# Altium schematic sheet Portable_filter.SchDoc
size A4; SheetNumber: 1; SheetTotal: 1
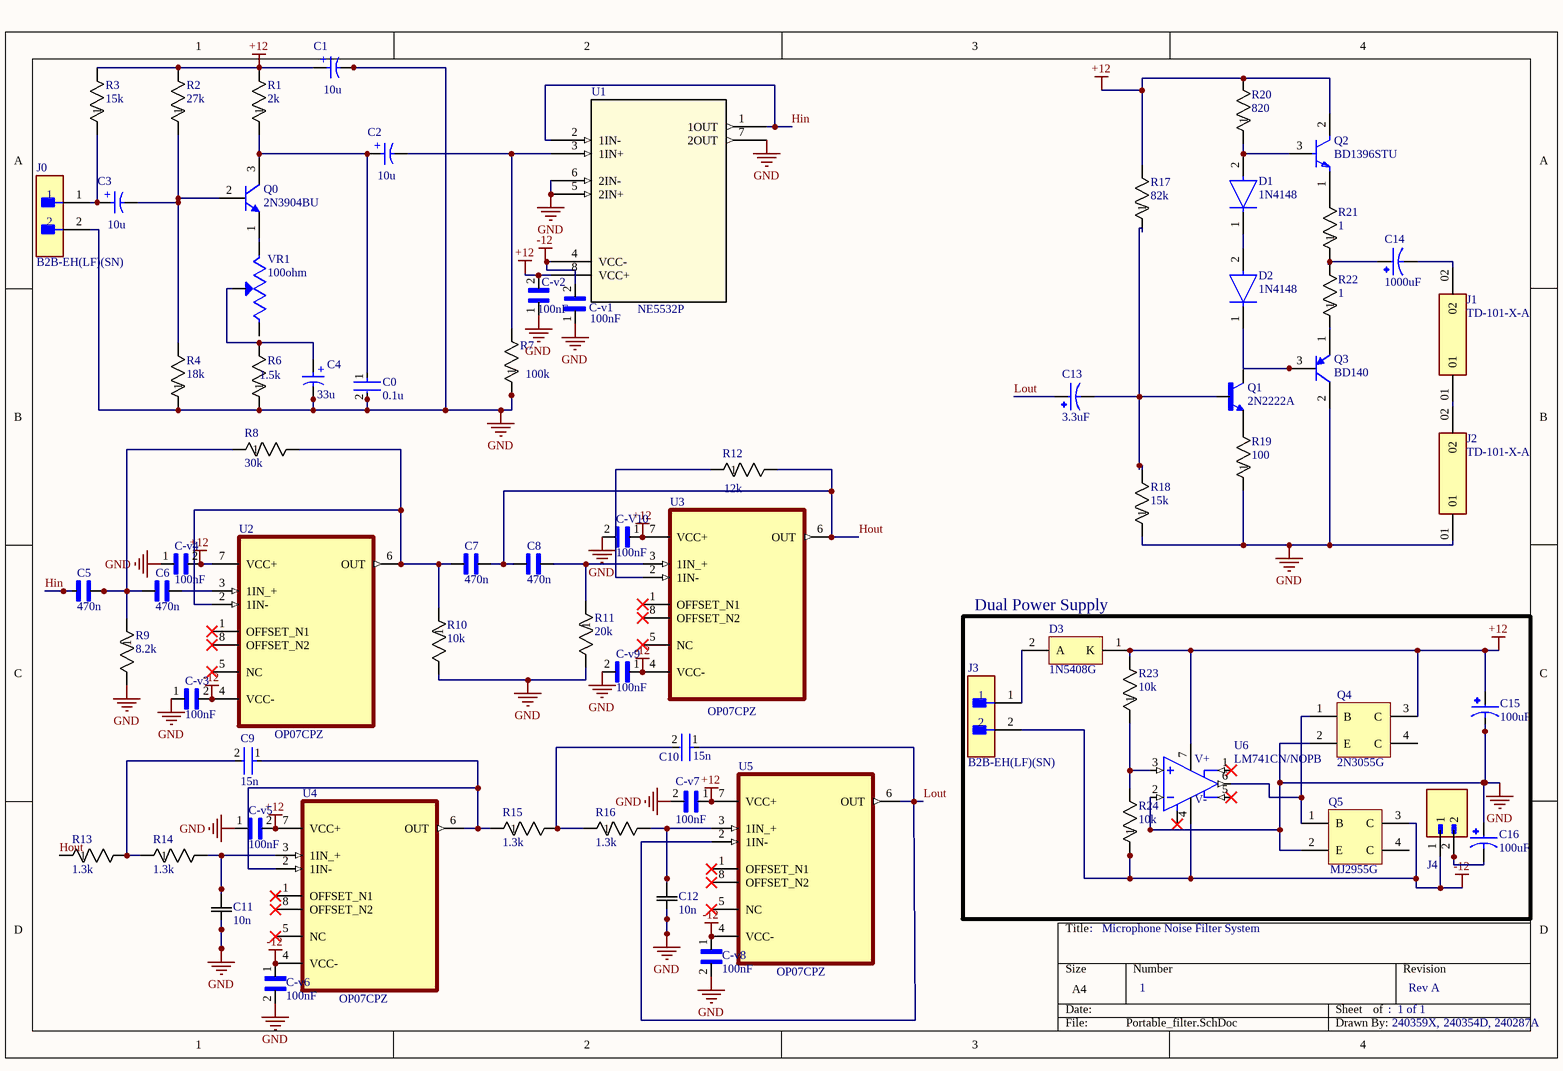
[diagram p0: Portable_filter.SchDoc]

## Parts
C0  0.1u  [FP-RCE2A2-MFG]
C1  10u  [WCAP-ATLL_D5H11]
C2  10u  [WCAP-ATLL_D5H11]
C3  10u  [WCAP-ATLL_D5H11]
C4  33u  [WCAP-ATG5_D6.3H11]
C5  470n  [CAPRR1000W60L1300T400H900]
C6  470n  [CAPRR1000W60L1300T400H900]
C7  470n  [CAPRR1000W60L1300T400H900]
C8  470n  [CAPRR1000W60L1300T400H900]
C9  15n  [FP-RDE0P1-MFG]
C10  15n  [FP-RDE0P1-MFG]
C11  10n  [K103K10X7RF53L2_VIS]
C12  10n  [K103K10X7RF53L2_VIS]
C13  3.3uF  [CAPPRD150W45D400H700]
C14  1000uF  [CAPPRD500W60D1000H2500]
C15  100uF  [CAPPRD250W50D630H1120]
C16  100uF  [CAPPRD250W50D630H1120]
C-v1  100nF  [CAPRR508W50L508T318H762]
C-v2  100nF  [CAPRR508W50L508T318H762]
C-v3  100nF  [CAPRR508W50L508T318H762]
C-v4  100nF  [CAPRR508W50L508T318H762]
C-v5  100nF  [CAPRR508W50L508T318H762]
C-v6  100nF  [CAPRR508W50L508T318H762]
C-v7  100nF  [CAPRR508W50L508T318H762]
C-v8  100nF  [CAPRR508W50L508T318H762]
C-v9  100nF  [CAPRR508W50L508T318H762]
C-V10  100nF  [CAPRR508W50L508T318H762]
D1  1N4148  [FP-017AG-MFG]
D2  1N4148  [FP-017AG-MFG]
D3  1N5408G  [ONSC-AXIAL_LEAD-2-267-05_V]
J0  B2B-EH(LF)(SN)  [FP-B2B-EH_LF_SN-MFG]
J1  TD-101-X-A  [SAMTEC_TD-101-X-A]
J2  TD-101-X-A  [SAMTEC_TD-101-X-A]
J3  B2B-EH(LF)(SN)  [FP-B2B-EH_LF_SN-MFG]
J4  M20-9990246  [HARWIN_M20-9990246]  (value not drawn)
Q0  2N3904BU  [FAIR-TO-92]
Q1  2N2222A  [TO92254P470H750-3]
Q2  BD1396STU  [FP-340AS-MFG]
Q3  BD140  [ONSC-TO-225-3-77-09]
Q4  2N3055G  [ONSC-TO-204-3-1-07]
Q5  MJ2955G  [ONSC-TO-204-3-1-07]
R1  2k  [RES_VISHAY_HVR37_VIS]
R2  27k  [RES_VISHAY_HVR37_VIS]
R3  15k  [RES_VISHAY_HVR37_VIS]
R4  18k  [RES_VISHAY_HVR37_VIS]
R6  1.5k  [RES_VISHAY_HVR37_VIS]
R7  100k  [RES_VISHAY_HVR37_VIS]
R8  30k  [RES_VISHAY_HVR37_VIS]
R9  8.2k  [RES_VISHAY_HVR37_VIS]
R10  10k  [RES_VISHAY_HVR37_VIS]
R11  20k  [RES_VISHAY_HVR37_VIS]
R12  12k  [RES_VISHAY_HVR37_VIS]
R13  1.3k  [RES_VISHAY_HVR37_VIS]
R14  1.3k  [RES_VISHAY_HVR37_VIS]
R15  1.3k  [RES_VISHAY_HVR37_VIS]
R16  1.3k  [RES_VISHAY_HVR37_VIS]
R17  82k  [RES_VISHAY_HVR37_VIS]
R18  15k  [RES_VISHAY_HVR37_VIS]
R19  100  [RES_VISHAY_HVR37_VIS]
R20  820  [RES_VISHAY_HVR37_VIS]
R21  1  [RES_VISHAY_HVR37_VIS]
R22  1  [RES_VISHAY_HVR37_VIS]
R23  10k  [RES_VISHAY_HVR37_VIS]
R24  10k  [RES_VISHAY_HVR37_VIS]
U1  NE5532P  [P8]
U2  OP07CPZ  [DIP254P762X508-8]
U3  OP07CPZ  [DIP254P762X508-8]
U4  OP07CPZ  [DIP254P762X508-8]
U5  OP07CPZ  [DIP254P762X508-8]
U6  LM741CN/NOPB  [DIP794W45P254L959H508Q8]
VR1  100ohm  [TRIM_3296W-1-101LF]

## Blocks framed on the sheet
Dual Power Supply: C15 C16 D3 J3 J4 Q4 Q5 R23 R24 U6

## Nets
+12: C1.1(P) C15.P C-v2.2 C-v4.2 C-v5.2 C-v7.1 C-V10.1 D3.1(K) Q2.2(C) Q4.3(C) R1.2 R2.2 R3.2 R17.2 R20.2 R23.2 U1.8(VCC+) U2.7(VCC+) U3.7(VCC+) U4.7(VCC+) U5.7(VCC+) U6.7(V+)
-12: C-v1.2 C-v3.2 C-v6.1 C-v8.1 C-v9.1 J3.2 J4.1 Q5.3(C) R24.1 U1.4(VCC-) U2.4(VCC-) U3.4(VCC-) U4.4(VCC-) U5.4(VCC-) U6.4(V-)
GND: C0.2 C1.2(N) C4.2(N) C11.2 C12.2 C15.N C16.P C-v1.1 C-v2.1 C-v3.1 C-v4.1 C-v5.1 C-v6.2 C-v7.2 C-v8.2 C-v9.2 C-V10.2 J0.2 J2.01 Q3.2(C) Q4.2(E) Q5.2(E) R4.1 R6.1 R7.1 R9.2 R10.2 R11.2 R18.1 R19.1 U1.5(2IN+) U1.6(2IN-) U1.7(2OUT) U6.2(-IN)
Hin: C5.1 U1.1(1OUT) U1.2(1IN-)
Hout: C7.2 C8.1 R12.2 R13.1 U3.6(OUT)
Lout: C10.1 C13.P U5.2(1IN-) U5.6(OUT)
NetC0_1: C0.1 C2.1(P) Q0.3(C) R1.1
NetC2_2: C2.2(N) R7.2 U1.3(1IN+)
NetC3_1: C3.1(P) J0.1 R3.1
NetC3_2: C3.2(N) Q0.2(B) R2.1 R4.2
NetC4_1: C4.1(P) R6.2 VR1.2(WIPER)
NetC5_2: C5.2 C6.1 R8.1 R9.1
NetC6_2: C6.2 U2.3(1IN_+)
NetC7_1: C7.1 R8.2 R10.1 U2.2(1IN-) U2.6(OUT)
NetC8_2: C8.2 R11.1 U3.3(1IN_+)
NetC9_1: C9.1 R15.1 U4.2(1IN-) U4.6(OUT)
NetC9_2: C9.2 R13.2 R14.1
NetC10_2: C10.2 R15.2 R16.1
NetC11_1: C11.1 R14.2 U4.3(1IN_+)
NetC12_1: C12.1 R16.2 U5.3(1IN_+)
NetC13_N: C13.N Q1.2(B) R17.1 R18.2
NetC14_N: C14.N J1.02
NetC14_P: C14.P R21.1 R22.2
NetC16_N: C16.N J4.2
NetD1_1: D1.1(C) D2.2(A)
NetD1_2: D1.2(A) Q2.3(B) R20.1
NetD2_1: D2.1(C) Q3.3(B)
NetD3_2: D3.2(A) J3.1
NetJ1_01: J1.01 J2.02
NetQ0_1: Q0.1(E) VR1.3(CW)
NetQ1_1: Q1.1(E) R19.2
NetQ2_1: Q2.1(E) R21.2
NetQ3_1: Q3.1(E) R22.1
NetQ4_1: Q4.1(B) Q5.1(B) U6.6(OUT)
NetR12_1: R12.1 U3.2(1IN-)
NetR23_1: R23.1 R24.2 U6.3(+IN)

Not connected (* = marked no-connect by the designer): Q1 3(C); Q4 4(C); Q5 4(C); U2 1(OFFSET_N1)* 5(NC)* 8(OFFSET_N2)*; U3 1(OFFSET_N1)* 5(NC)* 8(OFFSET_N2)*; U4 1(OFFSET_N1)* 5(NC)* 8(OFFSET_N2)*; U5 1(OFFSET_N1)* 5(NC)* 8(OFFSET_N2)*; U6 1(OFFSE_NULL1)* 5(OFFSET_NULL5)* 8(NC)*; VR1 1(CCW)

## Notes on the sheet
- :   Microphone Noise Filter System
- 1
- :  1 of 1
- Rev A
- 240359X,
- 240354D,
- 240287A
- (in symbol CMP-03913-53914205-2) +
- (in symbol CMP-03913-53914479-2) +

## Library data of the parts
C0 = CMP-06035-054740-1: Cap Ceramic 100nF 50V C0G ±5% Radial 2.5mm +125°C Automotive Ammo Pack
C1-C3 = CMP-03913-53914479-2: Alum. Electrolytic Cap 10UF 50V 5MM Radial Wcap-atll, Lifetime 4000H +105OC; Ripple Current: 120mA; Material: Aluminium; Leakage Current: 5µA; Pitch: 2mm; Capacitance: 10µF; Tolerance: 20%; Polarity: Polar; Impedance: 2.6Ω; Life (Hours): 4000hours; Length: 11mm; REACH SVHC: Unknown; Case/Package: Radial; Diameter: 5mm; Min Operating Temperature: -55°C; Voltage Rating: 50V; Mount: Through Hole; Lead Pitch: 2.0066mm; Packaging: Tape & Box (TB); Height: 11mm; Voltage Rating (DC): 50V; Height - Seated (Max): 12.4968mm; Max Operating Temperature: 105°C; RoHS: Compliant
C4 = CMP-03913-53914205-2: WCAP-ATG5 Aluminum Electrolytic Capacitors; Polarity: Polar; Tolerance: 20%; Ripple Current: 140mA; Voltage Rating: 35V; Leakage Current: 23.8µA; Pitch: 2.5mm; Life (Hours): 2000hours; Capacitance: 68µF; Height: 11mm; Mount: Through Hole; Case/Package: Radial; RoHS: Compliant; Lead Pitch: 2.4892mm; Packaging: Tape & Box (TB); Length: 11mm; Diameter: 6.3mm; Min Operating Temperature: -40°C; Height - Seated (Max): 12.4968mm; Max Operating Temperature: 105°C; Voltage Rating (DC): 35V
C5-C8 = B32521C1474J000: 0.47 ÂµF Film Capacitor 63V 100V Polyester, Polyethylene Terephthalate (PET), Metallized - Stacked Radial; MF: EPCOS; SnapEDA_Link: https://www.snapeda.com/parts/B32521C1474J000/EPCOS/view-part/?ref=snap; Package: Radial TDK; Value: *; MP: B32521C1474J000; Check_prices: https://www.snapeda.com/parts/B32521C1474J000/EPCOS/view-part/?ref=eda
C9 C10 = CMP-06035-018366-1: Ceramic Capacitor 15nF ±10% 100V X7R Radial; Lead Diameter: 0.5mm; Lead/Base Style: Formed Leads; Mount: Through Hole; Min Operating Temperature: -55°C; Voltage Rating (DC): 100V; Max Operating Temperature: 125°C; Voltage Rating: 100V; Lead Pitch: 0.098inch; Case/Package: Radial; Resistor Type: Ceramic; Width: 0.098inch; Dielectric: X7R; Capacitance: 15nF; Height: 3.5mm; Termination: Radial; Height - Seated (Max): 0.236inch; Tolerance: 10%; Package Quantity: 1; Packaging: Cut Tape; Length: 0.157inch
C11 C12 = K103K10X7RF53L2: K 50V 10nF Â±10% X7R BULK e3; Manufacturer_Name: Vishay; Type: Ceramic Capacitor; Copyright: Copyright (C) 2026 Ultra Librarian. All rights reserved.; Manufacturer_Part_Number: K103K10X7RF53L2; Datasheet: https://www.vishay.com/doc?45171
C13 = ECEA1EKN3R3: Aluminum Electrolytic Capacitors, KA-A (Bi-polar) Series, 3.3uF +/- 20%, 25V, Radial lead type(4x7mm); MF: Panasonic; MP: ECE-A1EKN3R3; SnapEDA_Link: https://www.snapeda.com/parts/ECE-A1EKN3R3/Panasonic/view-part/?ref=snap; Package: RADIAL-2 Panasonic; Value: *; Check_prices: https://www.snapeda.com/parts/ECE-A1EKN3R3/Panasonic/view-part/?ref=eda
C14 = EEUFR1E102LB_1: FR-A; MF: {'manufacturer': u'Panasonic Electronic Components'}; Package: None; Price: None; Value: *; MP: EEUFR1E102LB; Availability: Unavailable
C15 C16 = EEUHD1E101_1: Ø®Ø§Ø²Ù† Ù‡Ø§ÛŒ Ø§Ù„Ú©ØªØ±ÙˆÙ„ÛŒØªÛŒ Ø¢Ù„ÙˆÙ…ÛŒÙ†ÛŒÙˆÙ…ÛŒ 100F 25V Ø´Ø¹Ø§Ø¹ÛŒØŒ Ù‚ÙˆØ·ÛŒ 1000 Ø³Ø§Ø¹Øª @ 105C; MP: EEU-HD1E101; MF: Panasonic; Purchase-URL: https://pricing.snapeda.com/search/part/EEU-HD1E101/?ref=eda; Value: *; SnapEDA_Link: https://www.snapeda.com/parts/EEU-HD1E101/Panasonic/view-part/?ref=snap; Price: None; Package: RADIAL-2 Panasonic; Check_prices: https://www.snapeda.com/parts/EEU-HD1E101/Panasonic/view-part/?ref=eda; Availability: In Stock
C-v1-C-v9 C-V10 = AR215C104K4R: AR 100nF Ceramic Multilayer Cap,50V dc,+125C,X7R Dielectric,+/-10%,Through Hole | AVX AR215C104K4R; SnapEDA_Link: https://www.snapeda.com/parts/AR215C104K4R/AVX/view-part/?ref=snap; Package: Radial AVX; Value: *; MF: AVX; MP: AR215C104K4R; Check_prices: https://www.snapeda.com/parts/AR215C104K4R/AVX/view-part/?ref=eda
D1 D2 = CMP-07163-000046-1: DIODE GEN PURP 100V 200MA DO35; Forward Voltage: 1V; Max Power Dissipation: 500mW; Max Reverse Current: 5uA; Forward Current: 300mA; Current: 4A; Reverse Recovery Time: 4ns; Element Configuration: Single; Outside Diameter: 1.85mm; Capacitance: 4pF; Polarity: Standard; Max Forward Surge Current (Ifsm): 1A; Reverse Voltage: 100V; Output Current: 200mA; Average Rectified Current: 200mA; Diameter: 1.91mm; Max Repetitive Reverse Voltage (Vrrm): 100V; Current Rating: 200mA; Case/Package: DO-35; Lead Free: Lead Free; Number of Pins: 2; Recovery Time: 4ns; Packaging: Bulk; Contact Plating: Tin; Voltage: 100V; Mount: Through Hole; Max Surge Current: 4A; Package Quantity: 2000; Width: 1.91mm; Max Reverse Voltage (DC): 100V; Length: 4.56mm; Radiation Hardening: No; Power Dissipation: 500mW; Voltage Rating (DC): 100V; Peak Non-Repetitive Surge Current: 4A; REACH SVHC: No SVHC; Height: 4.56mm; Max Operating Temperature: 175°C; Series: -; Weight: 0.01lb; Min Operating Temperature: -65°C
D3 = CMP-0902-00036-1: Standard Recovery Rectifier, 2-Pin Axial_Lead, Pb-Free, Bulk Box; Manufacturer: On Semiconductor; IO(rec) Max (A): 3; IFSM Max (A): 200; VRRM Max (V): 1000; Packing: Bulk Box; PartNumber: 1N5408G; ComponentLink3URL: http://www.onsemi.com/pub_link/Collateral/267-05.PDF; ComponentLink2Description: Datasheet; ComponentLink1URL: http://www.onsemi.com/; DatasheetVersion: Rev. 10; RoHS: TRUE; ComponentLink2URL: http://www.onsemi.com/pub_link/Collateral/1N5400-D.PDF; ComponentLink1Description: Manufacturer URL; ComponentLink3Description: Package Specification; Mounting Technology: Through Hole; Type: Standard Recovery; PackageReference: AXIAL_LEAD-2-267-05; PackageDescription: 2-Pin, Axial Lead, Diameter 5.05 mm; PackageVersion: Rev. G, 06/2000
J0 J3 = CMP-17439-000683-1: Connector Header, EH Series, 2 Position, 2.5mm, Through Hole, Press-Fit, Solder, Natural; Voltage Rating: 250V; Current Rating: 3A; Number of Positions: 2; Lead Free: Lead Free; Series: EH; Orientation: Straight; Pitch: 2.5mm; Termination: Solder; Mount: Through Hole; Number of Rows: 1; Contact Material: Brass; Number of Contacts: 2
J1 J2 = TD-101-X-A: 2 Position Header Connector Male Pin Gold; MF: Samtec Inc.; MP: TD-101-G-A; SnapEDA_Link: https://www.snapeda.com/parts/TD-101-G-A/Samtec+Inc./view-part/?ref=snap; Package: None; Value: *; Check_prices: https://www.snapeda.com/parts/TD-101-G-A/Samtec+Inc./view-part/?ref=eda
J4 = M20-9990246: 2.54mm (0.1) Pitch SIL Vertical Throughboard Pin Header, 6.1mm mating pin height, tin, 2 contacts; MF: Harwin; SnapEDA_Link: https://www.snapeda.com/parts/M20-9990246/Harwin/view-part/?ref=snap; Package: None; Value: *; MP: M20-9990246; Check_prices: https://www.snapeda.com/parts/M20-9990246/Harwin/view-part/?ref=eda
Q0 = CMP-2000-04944-1: NPN General-Purpose Amplifier, 40 V VCEO, 0.2 A, -55 to 150 degC, 2-Pin TO-92, RoHS, Bulk; Manufacturer: FairchildSemiconductor; Maximum Collector Base Voltage: 60V; Minimum DC Current Gain: 40@0.1mA@1V; Maximum Collector Emitter Voltage: 40V; Maximum DC Collector Current: 0.2A; Rad Hard: No; Maximum Operating Frequency: 300(Min)MHz; Maximum Collector Emitter Saturation Voltage: 0.2@1mA@10mA; Maximum Power Dissipation: 625mW; Package Description: 3-Pin Transistor Outline Package, Body Dia 4.79 mm, Pitch 1.27 mm; Package Reference: TO-92; Pin Count: 3; Operating Temperature: -55to150degC; Category: GPBJT; Manufacturer URL: https://www.fairchildsemi.com/; Datasheet URL: https://datasheet.ciiva.com/4722/2n3904-82270-4722369.pdf; Package: 3TO-92; Packaging: Bulk; Type: NPN; Datasheet Version: Rev. 1.1.0, 10/2014; Mounting: ThroughHole
Q1 = 2N2222A: BJT, TO-92, 40V, 600mA, NPN, 0.625W, 150Â°C; MF: Diotec Semiconductor; SnapEDA_Link: https://www.snapeda.com/parts/2N2222A/Diotec/view-part/?ref=snap; Package: TO-92 Diotec; Value: *; MP: 2N2222A; Check_prices: https://www.snapeda.com/parts/2N2222A/Diotec/view-part/?ref=eda
Q2 = CMP-00278-84408977-1: BD1396STU Bipolar Transistors - BJT NPN Si Transistor Epitaxial; Manufacturer Lifecycle Status: OBSOLETE; Collector Emitter Voltage (VCEO): 80V; Power Dissipation: 1.25W; Max Power Dissipation: 12.5W; Max Collector Current: 1.5A; Emitter Base Voltage (VEBO): 5V; Number of Elements: 1; hFE Min: 40; Max Junction Temperature (Tj): 150°C; Element Configuration: Single; Collector Emitter Saturation Voltage: 500mV; REACH SVHC: No SVHC; Number of Pins: 3; Polarity: NPN; Min Operating Temperature: -55°C; Lifecycle Status: Obsolete; Length: 8.3mm; NexarPartId: 84408977; Height: 11.2mm; Voltage Rating (DC): 80V; Width: 3.45mm; Collector Base Voltage (VCBO): 80V; Current Rating: 1.5A; Weight: 761mg; Lead Free: Lead Free; Mount: Through Hole; Contact Plating: Tin; Collector Emitter Breakdown Voltage: 80V; RoHS: Compliant; Case/Package: TO-126-3; Max Operating Temperature: 150°C
Q3 = CMP-1048-00039-1: Plastic Medium-Power Silicon PNP Transistor, 3-Pin TO-225, Bulk Box; Manufacturer: On Semiconductor; IC Continuous (A): 1.5; PartNumber: BD140; ComponentLink1Description: Manufacturer URL; RoHS: FALSE; ComponentLink1URL: http://www.onsemi.com/; DatasheetVersion: Rev. 15; ComponentLink2URL: http://www.onsemi.com/pub_link/Collateral/BD136-D.PDF; ComponentLink3Description: Package Specification; Packing: Bulk Box; PackageVersion: Rev. AC, 12/2013; ComponentLink3URL: http://www.onsemi.com/pub_link/Collateral/77-09.PDF; PackageDescription: 3-Pin Flange Mount, Vertical Straight Lead, Body 7.6 x 2.7 mm, Pitch 2.29 mm; Mounting Technology: Through Hole; PackageReference: TO-225-3-77-09; ComponentLink2Description: Datasheet; Polarity: PNP
Q4 = CMP-1048-01043-1: Complementary Silicon Power Transistor, 3-Pin TO-204, Pb-Free, Tray; Manufacturer: On Semiconductor; IC Continuous (A): 15; Polarity: NPN; fT Min (MHz): 2.5; PackageDescription: 2-Pin Transistor Outline, Body 39.37 x 26.67 mm, Pitch 10.92 mm; Mounting Technology: Through Hole; PackageVersion: Rev. Z, 05/1988; ComponentLink1URL: http://www.onsemi.com/; ComponentLink3Description: Package Specification; Packing: Tray; RoHS: TRUE; ComponentLink2URL: http://www.onsemi.com/pub_link/Collateral/2N3055-D.PDF; ComponentLink1Description: Manufacturer URL; DatasheetVersion: Rev. 6; ComponentLink3URL: http://www.onsemi.com/pub_link/Collateral/1-07.PDF; PackageReference: TO-204-3-1-07; PartNumber: 2N3055G; ComponentLink2Description: Datasheet
Q5 = CMP-1048-01033-1: Complementary Silicon Power Transistor, 3-Pin TO-204, Pb-Free, Tray; Manufacturer: On Semiconductor; Polarity: PNP; IC Continuous (A): 15; fT Min (MHz): 2.5; ComponentLink1Description: Manufacturer URL; Packing: Tray; PackageVersion: Rev. Z, 05/1988; DatasheetVersion: Rev. 6; PartNumber: MJ2955G; Mounting Technology: Through Hole; ComponentLink2Description: Datasheet; ComponentLink3URL: http://www.onsemi.com/pub_link/Collateral/1-07.PDF; PackageReference: TO-204-3-1-07; ComponentLink1URL: http://www.onsemi.com/; ComponentLink2URL: http://www.onsemi.com/pub_link/Collateral/2N3055-D.PDF; ComponentLink3Description: Package Specification; PackageDescription: 2-Pin Transistor Outline, Body 39.37 x 26.67 mm, Pitch 10.92 mm; RoHS: TRUE
R1-R4 R6-R24 = HVR3700001004FR500: 1% 1/2W Metal Flim; Manufacturer_Name: Vishay; Copyright: Copyright (C) 2025 Ultra Librarian. All rights reserved.
U1 = NE5532P: Dual, 30-V, 10-MHz, low-noise operational amplifier for audio applications 8-PDIP 0 to 70; Manufacturer_Name: Texas Instruments; Copyright: Copyright (C) 2026 Ultra Librarian. All rights reserved.; Manufacturer_Part_Number: NE5532P; RefDes: RefDes; Type: Type
U2-U5 = OP07CPZ: Ultralow Offset Voltage Op Amp; MF: Analog Devices; SnapEDA_Link: https://www.snapeda.com/parts/OP07CPZ/Analog+Devices/view-part/?ref=snap; Package: PDIP-8 Analog Devices; Value: *; MP: OP07CPZ; Check_prices: https://www.snapeda.com/parts/OP07CPZ/Analog+Devices/view-part/?ref=eda
U6 = LM741CN/NOPB: Single, 44-V, 1-MHz operational amplifier; MF: Texas Instruments; SnapEDA_Link: https://www.snapeda.com/parts/LM741CN/NOPB/Texas+Instruments/view-part/?ref=snap; Package: PDIP-8 Texas; Value: *; MP: LM741CN/NOPB; Check_prices: https://www.snapeda.com/parts/LM741CN/NOPB/Texas+Instruments/view-part/?ref=eda
VR1 = 3296W-1-101LF: 3/8 Sq, Thru-Hole, TRIMMER, 100 ohms, Cermet, 25 Turns, Pwr-Rtg 0.5W | Bourns 3296W-1-101LF; SnapEDA_Link: https://www.snapeda.com/parts/3296W-1-101LF/Bourns/view-part/?ref=snap; Package: NON STANDARD-3 Bourns; Value: *; MF: Bourns; MP: 3296W-1-101LF; Check_prices: https://www.snapeda.com/parts/3296W-1-101LF/Bourns/view-part/?ref=eda